# Altium schematic sheet Afrodite V10_Final_3K (2).SchDoc
size A2
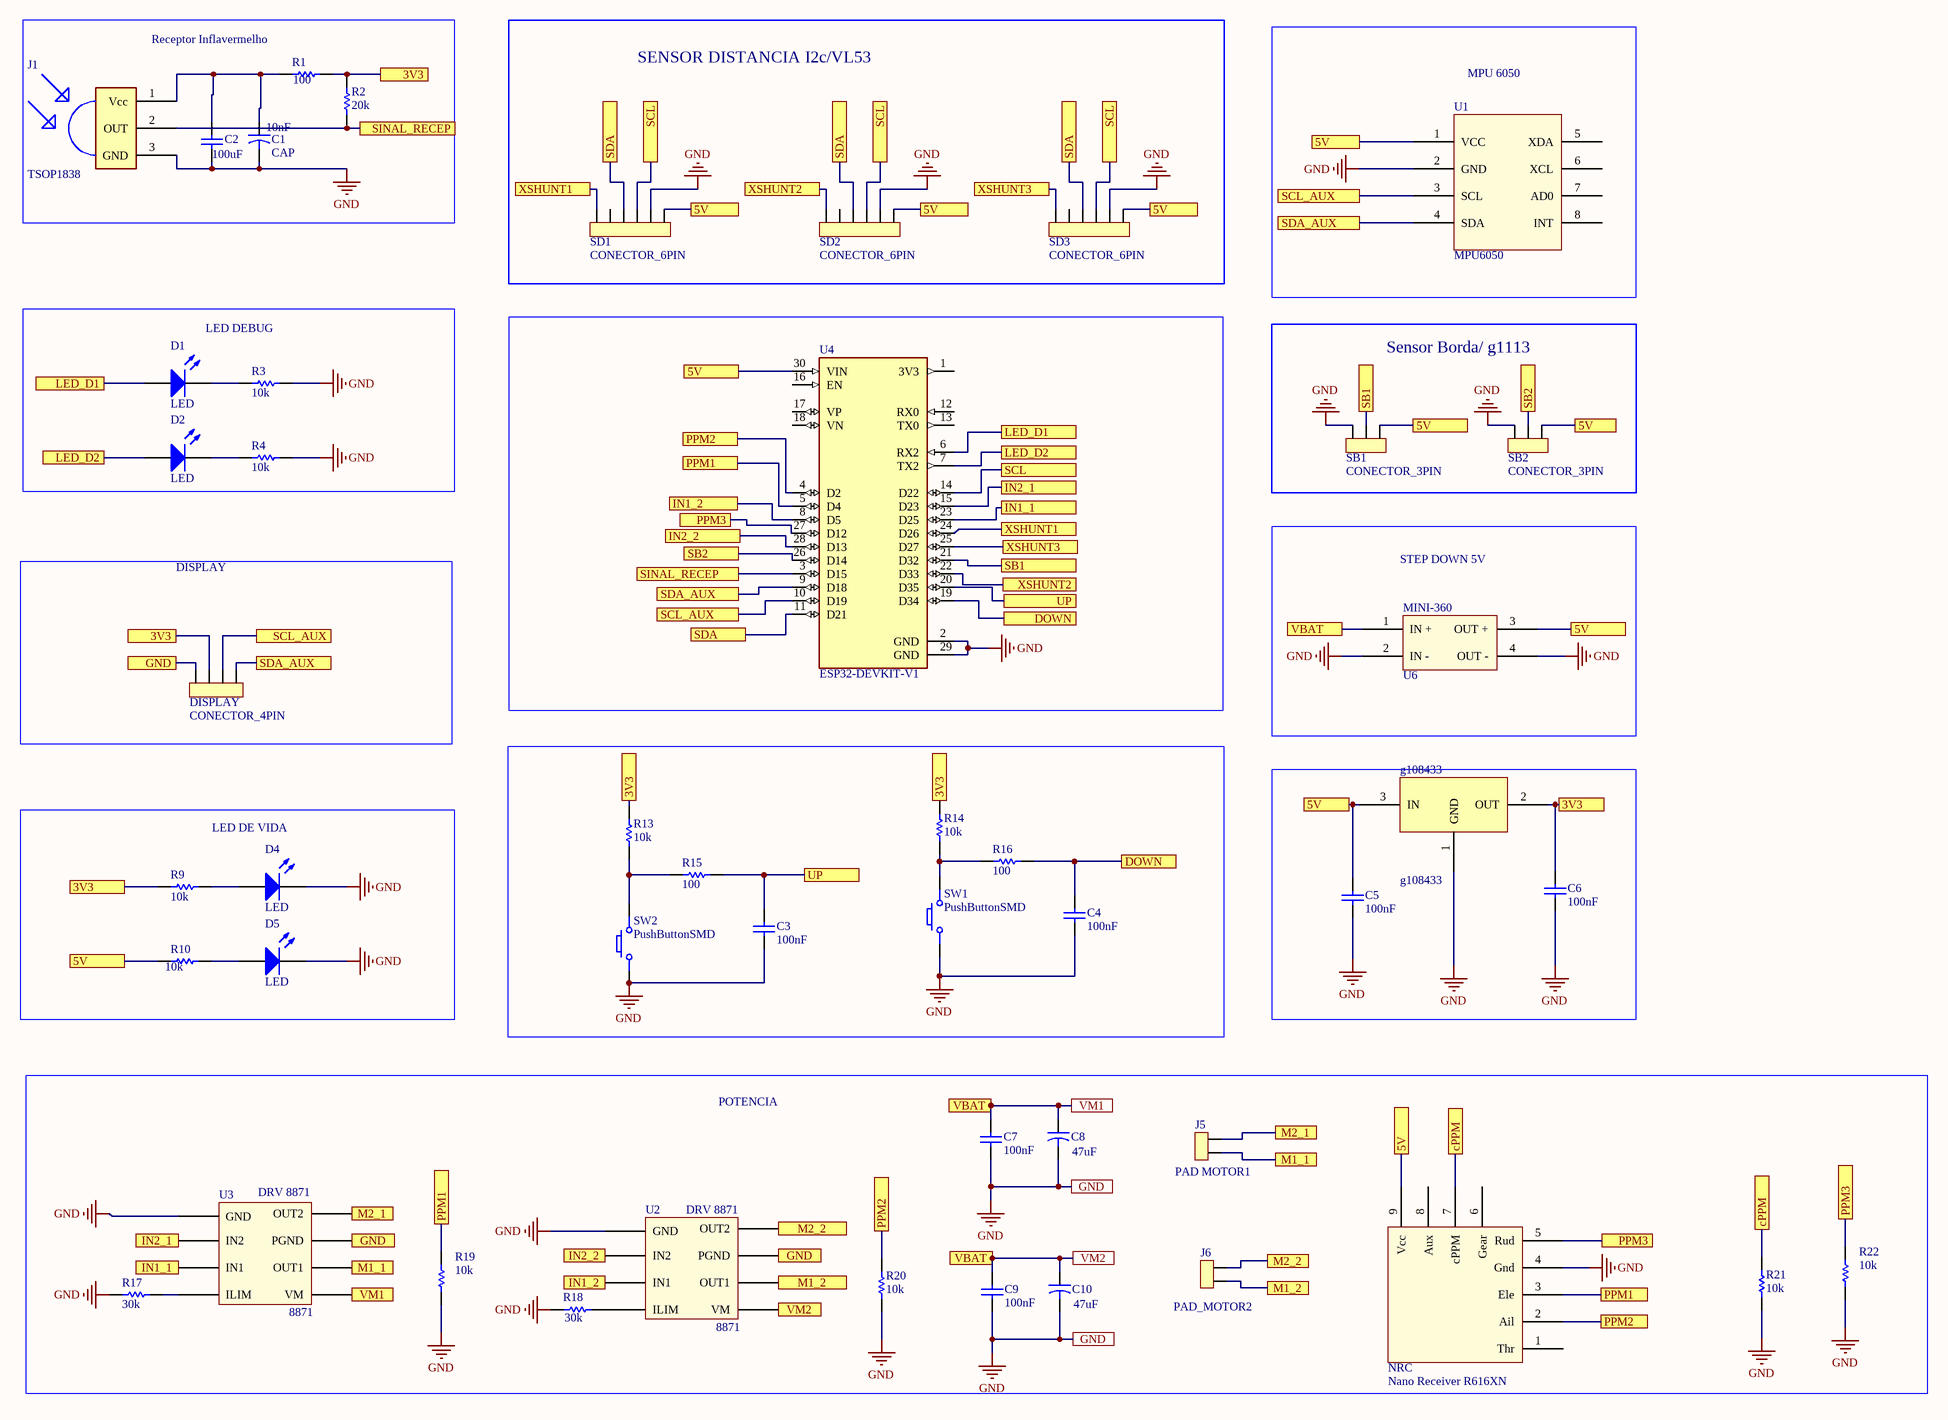
[diagram p0: Afrodite V10_Final_3K (2).SchDoc]

## Parts
C1  CAP  Valor: 10nF  [CAP ELET .100]
C2  Valor: 100uF  [CAP 0805]  (hidden comment: CAP)
C3  Valor: 100nF  [CAP 0805]  (hidden comment: CAP)
C4  Valor: 100nF  [CAP 0805]  (hidden comment: CAP)
C5  Valor: 100nF  [CAP 0805]  (hidden comment: CAP)
C6  Valor: 100nF  [CAP 0805]  (hidden comment: CAP)
C7  Valor: 100nF  [CAP 0805]  (hidden comment: CAP)
C8  Valor: 47uF  [CAP ELET .100]
C9  Valor: 100nF  [CAP 0805]  (hidden comment: CAP)
C10  Valor: 47uF  [CAP ELET .100]
D1  LED  [LED 0805]
D2  LED  [LED 0805]
D4  LED  [LED 0805]
D5  LED  [LED 0805]
DISPLAY  CONECTOR_4PIN  [CON4]
g108433  g108433  [TO263-3]
J1  TSOP1838  [TSOP18XX]
J5  PAD MOTOR1  [CON2]
J6  PAD_MOTOR2  [CON2]
NRC  value Nano Receiver R616XN  [Receiver]  (hidden comment: Nano Receiver)
R1  value 100  [RES 0805]  (hidden comment: RESISTOR)
R2  value 20k  [RES 0805]  (hidden comment: RESISTOR)
R3  value 10k  [RES 0805]  (hidden comment: RESISTOR)
R4  value 10k  [RES 0805]  (hidden comment: RESISTOR)
R9  value 10k  [RES 0805]  (hidden comment: RESISTOR)
R10  value 10k  [RES 0805]  (hidden comment: RESISTOR)
R13  value 10k  [RES 0805]  (hidden comment: RESISTOR)
R14  value 10k  [RES 0805]  (hidden comment: RESISTOR)
R15  value 100  [RES 0805]  (hidden comment: RESISTOR)
R16  value 100  [RES 0805]  (hidden comment: RESISTOR)
R17  value 30k  [RES 0805]  (hidden comment: RESISTOR)
R18  value 30k  [RES 0805]  (hidden comment: RESISTOR)
R19  value 10k  [RES 0805]  (hidden comment: RESISTOR)
R20  value 10k  [RES 0805]  (hidden comment: RESISTOR)
R21  value 10k  [RES 0805]  (hidden comment: RESISTOR)
R22  value 10k  [RES 0805]  (hidden comment: RESISTOR)
SB1  CONECTOR_3PIN  [CON3]
SB2  CONECTOR_3PIN  [CON3]
SD1  CONECTOR_6PIN  [CON6]
SD2  CONECTOR_6PIN  [CON6]
SD3  CONECTOR_6PIN  [CON6]
SW1  PushButtonSMD  [PUSHBUTTON.SMD]
SW2  PushButtonSMD  [PUSHBUTTON.SMD]
U1  value MPU6050  [mpu6050]  (hidden comment: Sensor giroscopio acelerometro)
U2  DRV 8871  [DRV-8871]
U3  DRV 8871  [DRV-8871]
U4  ESP32-DEVKIT-V1  [MODULE_ESP32_DEVKIT_V1]
U6  value MINI-360  [PCBComponent_1]  (hidden comment: Regulador de Tensão)

## Blocks framed on the sheet
Receptor Inflavermelho: C1 C2 J1 R1 R2
SENSOR DISTANCIA I2c/VL53: SD1-SD3
MPU 6050: U1
LED DEBUG: D1 D2 R3 R4
Sensor Borda/ g1113: SB1 SB2
DISPLAY: DISPLAY
STEP DOWN 5V: U6
REGULADOR 3V3: C5 C6 g108433
LED DE VIDA: D4 D5 R9 R10
POTENCIA: C7-C10 J5 J6 NRC R17-R22 U2 U3

## Ports
3V3, 5V, cPPM, DOWN, GND, IN1_1, IN1_2, IN2_1, IN2_2, LED_D1, LED_D2, M1_1, M1_2, M2_1, M2_2, PPM1, PPM2, PPM3, SB1, SB2, SCL, SCL_AUX, SDA, SDA_AUX, SINAL_RECEP, UP, VBAT, VM1, VM2, XSHUNT1, XSHUNT2, XSHUNT3

## Nets
GND: C1.1 C2.1 C3.1 C4.1 C5.1 C6.1 C7.1 C8.1 C9.1 C10.1 D4.2(K) D5.2(K) DISPLAY.1 g108433.1(GND) J1.3(GND) NRC.4(Gnd) R3.2 R4.2 R17.1 R18.1 R19.1 R20.1 R21.1 R22.1 SB1.1 SB2.1 SD1.5 SD2.5 SD3.5 SW1.1 SW2.1 U1.2(GND) U2.1(GND) U2.7(PGND) U3.1(GND) U3.7(PGND) U4.2(GND) U4.29(GND) U6.2(IN_-) U6.4(OUT_-) ; port GND
3V3: C6.2 DISPLAY.2 g108433.2(OUT) R1.2 R2.2 R9.1 R13.2 R14.2 ; port 3V3
5V: C5.2 g108433.3(IN) NRC.9(Vcc) R10.1 SB1.3 SB2.3 SD1.6 SD2.6 SD3.6 U1.1(VCC) U4.30(VIN) U6.3(OUT_+) ; port 5V
cPPM: NRC.7(cPPM) R21.2 ; port cPPM
DOWN: C4.2 R16.2 U4.19(D34) ; port DOWN
IN1_1: U3.3(IN1) U4.23(D25) ; port IN1_1
IN1_2: U2.3(IN1) U4.8(D5) ; port IN1_2
IN2_1: U3.2(IN2) U4.15(D23) ; port IN2_1
IN2_2: U2.2(IN2) U4.28(D13) ; port IN2_2
LED_D1: D1.1(A) U4.6(RX2) ; port LED_D1
LED_D2: D2.1(A) U4.7(TX2) ; port LED_D2
M1_1: J5.2 U3.6(OUT1) ; port M1_1
M1_2: J6.2 U2.6(OUT1) ; port M1_2
M2_1: J5.1 U3.8(OUT2) ; port M2_1
M2_2: J6.1 U2.8(OUT2) ; port M2_2
PPM1: NRC.3(Ele) R19.2 U4.5(D4) ; port PPM1
PPM2: NRC.2(Ail) R20.2 U4.4(D2) ; port PPM2
PPM3: NRC.5(Rud) R22.2 U4.27(D12) ; port PPM3
SB1: SB1.2 U4.21(D32) ; port SB1
SB2: SB2.2 U4.26(D14) ; port SB2
SCL: SD1.4 SD2.4 SD3.4 U4.14(D22) ; port SCL
SCL_AUX: DISPLAY.3 U1.3(SCL) U4.10(D19) ; port SCL_AUX
SDA: SD1.3 SD2.3 SD3.3 U4.11(D21) ; port SDA
SDA_AUX: DISPLAY.4 U1.4(SDA) U4.9(D18) ; port SDA_AUX
SINAL_RECEP: J1.2(OUT) R2.1 U4.3(D15) ; port SINAL_RECEP
UP: C3.2 R15.2 U4.20(D35) ; port UP
VBAT: C7.2 C8.2 C9.2 C10.2 U2.5(VM) U3.5(VM) U6.1(IN_+) ; port VBAT, port VM1, port VM2
XSHUNT1: SD1.1 U4.24(D26) ; port XSHUNT1
XSHUNT2: SD2.1 U4.22(D33) ; port XSHUNT2
XSHUNT3: SD3.1 U4.25(D27) ; port XSHUNT3
NetC1_2: C1.2 C2.2 J1.1(Vcc) R1.1
NetD1_2: D1.2(K) R3.1
NetD2_2: D2.2(K) R4.1
NetD4_1: D4.1(A) R9.2
NetD5_1: D5.1(A) R10.2
NetR13_1: R13.1 R15.1 SW2.2
NetR14_1: R14.1 R16.1 SW1.2
NetR17_2: R17.2 U3.4(ILIM)
NetR18_2: R18.2 U2.4(ILIM)

Not connected (* = marked no-connect by the designer): NRC 1(Thr) 6(Gear) 8(Aux); SD1 2; SD2 2; SD3 2; U1 5(XDA) 6(XCL) 7(AD0) 8(INT); U4 1(3V3) 12(RX0) 13(TX0) 16(EN) 17(VP) 18(VN)

## Notes on the sheet
- (in symbol DRV 8871) 8871

## Library data of the parts
C1 C8 C10 = CAP. ELETROLÍTICO: Capacitor
C2-C7 C9 = CAP. CERÂMICO: Capacitor; Criador por: Luigi Eduardo; Pertence a: Trincabotz; Criado em: 26/06/2012
J1 = TSOP1838: IR Receiver and Demodulator; Value: *; MP: TSOP1838; Package: None; Availability: Unavailable; Price: None
J5 J6 = CONECTOR_2PIN
NRC = Receiver: Orange R616XN Nano Receiver
U1 = mpu6050: Sera usado na afrodite
U4 = ESP32-DEVKIT-V1: Dual core, Wi-Fi: 2.4 GHz up to 150 Mbits/s,BLE (Bluetooth Low Energy) and legacy Bluetooth, 32 bits, Up to 240 MHz; Value: *; MP: ESP32-DEVKIT-V1; Availability: Unavailable; Package: None; Price: None
U6 = Rregulador-Mini-360: Mini Regulador de Tensão Ajustável / Step Down - Saída 1V a 17VDC